# Altium project Task_Tony.PrjPcb (part 3 of 8)

## Sheet Audio_Codec_Sec.SchDoc
size A4; DocumentNumber: 8; SheetNumber: 8; SheetTotal: 28
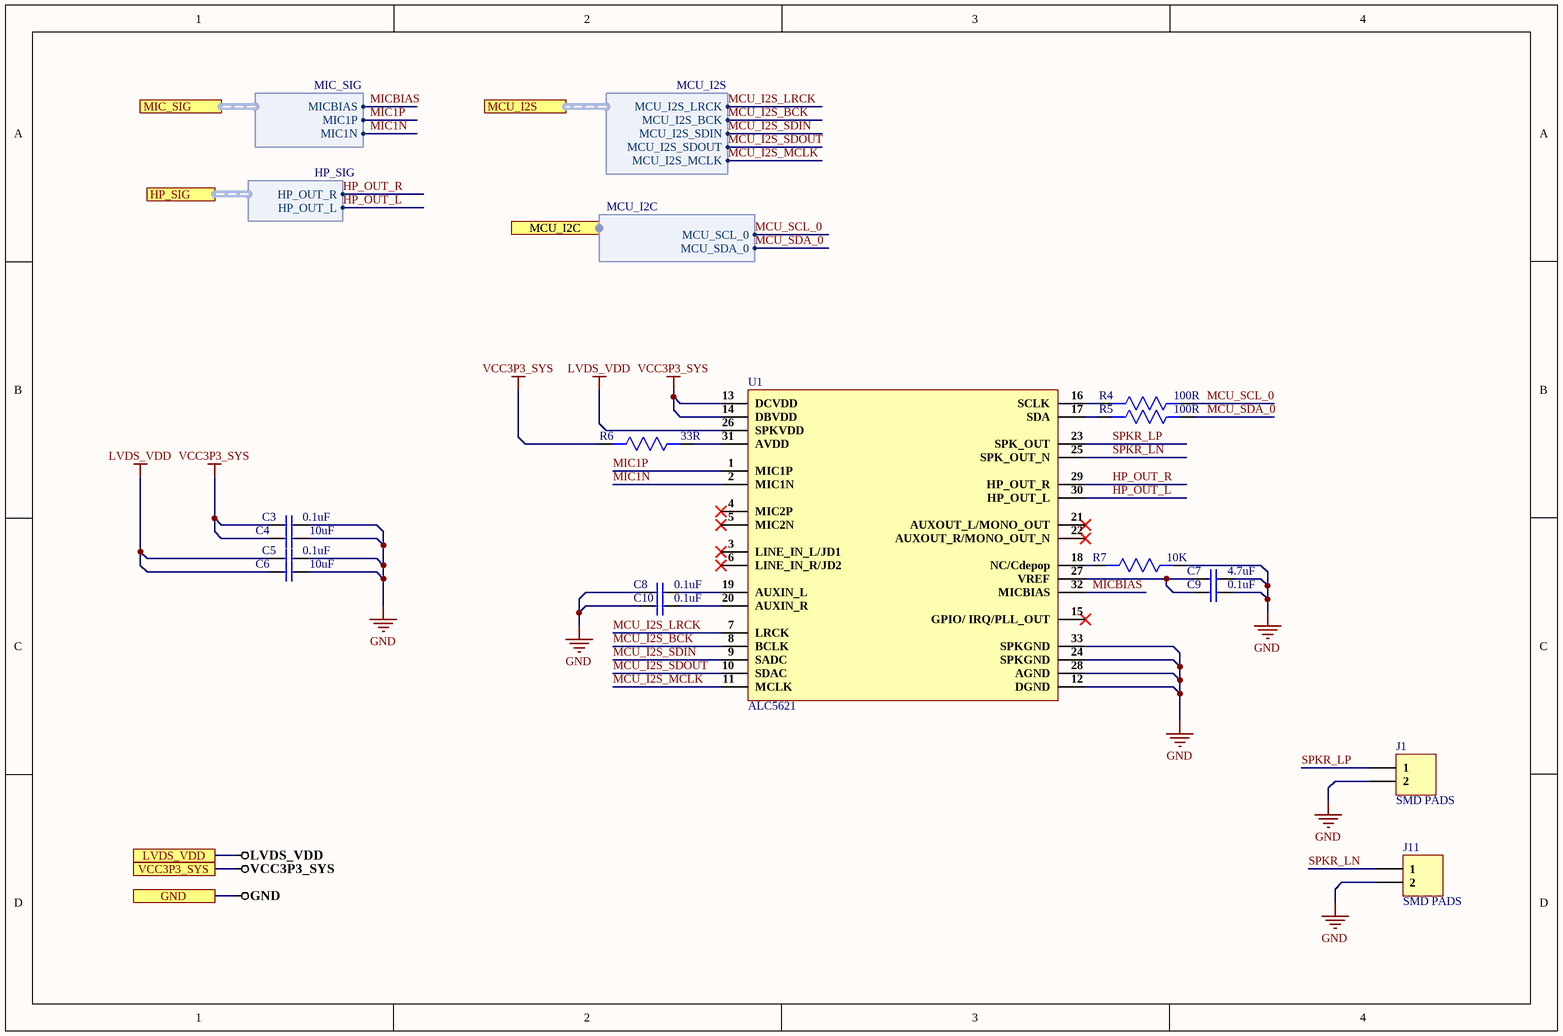
[diagram p11: Audio_Codec_Sec.SchDoc]

### Parts
C3  0.1uF  [Cap0603]
C4  10uF  [Cap0603]
C5  0.1uF  [Cap0603]
C6  10uF  [Cap0603]
C7  4.7uF  [Cap0603]
C8  0.1uF  [Cap0603]
C9  0.1uF  [Cap0603]
C10  0.1uF  [Cap0603]
J1  SMD PADS  [SMD PAD]
J11  SMD PADS  [SMD PAD]
R4  100R  [Res0603]
R5  100R  [Res0603]
R6  33R  [Res0603]
R7  10K  [Res0603]
U1  ALC5621  [32-QFN]

### Ports
GND, HP_SIG (harness HP_SIG), LVDS_VDD, MCU_I2C (harness MCU_I2C), MCU_I2S (harness MCU_I2S), MIC_SIG (harness MIC_SIG), VCC3P3_SYS

### Harnesses
HP_SIG: HP_OUT_R, HP_OUT_L
MCU_I2S: MCU_I2S_LRCK, MCU_I2S_BCK, MCU_I2S_SDIN, MCU_I2S_SDOUT, MCU_I2S_MCLK
MIC_SIG: MICBIAS, MIC1P, MIC1N
MCU_I2C: MCU_SCL_0, MCU_SDA_0

### Nets
GND: C3.2 C4.2 C5.2 C6.2 C7.2 C8.1 C9.2 C10.1 J1.2 J11.2 R7.1 U1.12(DGND) U1.24(SPKGND) U1.28(AGND) U1.33(SPKGND) ; port GND
LVDS_VDD: C5.1 C6.1 U1.26(SPKVDD) ; port LVDS_VDD
VCC3P3_SYS: C3.1 C4.1 R6.2 U1.13(DCVDD) U1.14(DBVDD) ; port VCC3P3_SYS  [project net VCC 3P3_SYS]
HP_OUT_L: U1.30(HP_OUT_L) ; port HP_SIG.HP_OUT_L
HP_OUT_R: U1.29(HP_OUT_R) ; port HP_SIG.HP_OUT_R
MCU_I2S_BCK: U1.8(BCLK) ; port MCU_I2S.MCU_I2S_BCK  [project net MCU_I2S.MCU_I2S_BCK]
MCU_I2S_LRCK: U1.7(LRCK) ; port MCU_I2S.MCU_I2S_LRCK  [project net MCU_I2S.MCU_I2S_LRCK]
MCU_I2S_MCLK: U1.11(MCLK) ; port MCU_I2S.MCU_I2S_MCLK  [project net MCU_I2S.MCU_I2S_MCLK]
MCU_I2S_SDIN: U1.9(SADC) ; port MCU_I2S.MCU_I2S_SDIN  [project net MCU_I2S.MCU_I2S_SDIN]
MCU_I2S_SDOUT: U1.10(SDAC) ; port MCU_I2S.MCU_I2S_SDOUT  [project net MCU_I2S.MCU_I2S_SDOUT]
MCU_SCL_0: R4.1 ; port MCU_I2C.MCU_SCL_0  [project net MCU_I2C.MCU_SCL_0]
MCU_SDA_0: R5.1 ; port MCU_I2C.MCU_SDA_0  [project net MCU_I2C.MCU_SDA_0]
MIC1N: U1.2(MIC1N) ; port MIC_SIG.MIC1N
MIC1P: U1.1(MIC1P) ; port MIC_SIG.MIC1P
MICBIAS: U1.32(MICBIAS) ; port MIC_SIG.MICBIAS
SPKR_LN: J11.1 U1.25(SPK_OUT_N)
SPKR_LP: J1.1 U1.23(SPK_OUT)
NetC7_1: C7.1 C9.1 U1.27(VREF)
NetC8_2: C8.2 U1.19(AUXIN_L)
NetC10_2: C10.2 U1.20(AUXIN_R)
NetR4_2: R4.2 U1.16(SCLK)
NetR5_2: R5.2 U1.17(SDA)
NetR6_1: R6.1 U1.31(AVDD)
NetR7_2: R7.2 U1.18(NC/Cdepop)

Not connected (* = marked no-connect by the designer): U1 3(LINE_IN_L/JD1)* 4(MIC2P)* 5(MIC2N)* 6(LINE_IN_R/JD2)* 15(GPIO/_IRQ/PLL_OUT)* 21(AUXOUT_L/MONO_OUT)* 22(AUXOUT_R/MONO_OUT_N)*

### Library data of the parts
C3 C5 C8-C10 = CC0603ZRY5V9BB104: CAP CER 0.1UF 50V Y5V 0603; Manufacturer: Yageo; Capacitance: 100nF; Tolerance: 80%; Supplier 1: Digi-Key; Manufacturer Part Number: CC0603ZRY5V9BB104; Stock 1: 15000880; Pricing 1: 1=0.1, 10=0.075, 100=0.0334, 500=0.02386, 1000=0.01874 (USD); Mount: Surface Mount; Case/Package: 0603; Number of Pins: 2; Case Code (Metric): 1608; Case Code (Imperial): 0603; Min Operating Temperature: -30°C; Max Operating Temperature: 85°C; Dielectric: Y5V; Voltage Rating: 50V; Package Quantity: 1; Packaging: Tape and Reel; Voltage Rating (DC): 50V; Termination: SMD/SMT; Composition: Ceramic; Voltage: 50V; Length: 1.6mm; Height: 0.8mm; Width: 0.031inch; Thickness: 0.035inch; Depth: 0.8mm; Radiation Hardening: No; REACH SVHC: No SVHC; Lead Free: Lead Free; Halogen Free: Halogen Free; ComponentLink1URL: http://www.yageo.com/documents/recent/UPY-GPHC_Y5V_6.3V-to-50V_8.pdf?src-supplier=Digi-Key; ComponentLink1Description: http://www.yageo.com/documents/recent/UPY-GPHC_Y5V_6.3V-to-50V_8.pdf?src-supplier=Digi-Key; ComponentLink2URL: http://www.yageo.com/documents/recent/UPY-GPHC_Y5V_6.3V-to-50V_5.pdf?src-supplier=Avnet+Europe; ComponentLink2Description: http://www.yageo.com/documents/recent/UPY-GPHC_Y5V_6.3V-to-50V_5.pdf?src-supplier=Avnet+Europe; ComponentLink3URL: https://www.verical.com/server-webapp/html/getDatasheet?partID=403611&src-supplier=Verical; ComponentLink3Description: https://www.verical.com/server-webapp/html/getDatasheet?partID=403611&src-supplier=Verical; ComponentLink4URL: http://www.mouser.com/ds/2/447/Yageo_UPY-GP_NP0_16V-to-50V_9-358835.pdf?src-supplier=Mouser; ComponentLink4Description: http://www.mouser.com/ds/2/447/Yageo_UPY-GP_NP0_16V-to-50V_9-358835.pdf?src-supplier=Mouser; ComponentLink5URL: http://www.farnell.com/datasheets/1132289.pdf?src-supplier=Element14; ComponentLink5Description: http://www.farnell.com/datasheets/1132289.pdf?src-supplier=Element14; Supplier Part Number 1: 311-1343-1-ND
C4 C6 = GRM188R6YA106MA73D: CAP CER 10UF 35V X5R 0603; Manufacturer: Murata; Tolerance: 20%; Supplier 1: Digi-Key; Manufacturer Part Number: GRM188R6YA106MA73D; Stock 1: 11640; Pricing 1: 1=0.5, 10=0.346, 100=0.2076, 500=0.1557, 1000=0.13148 (USD); Mount: Surface Mount; Case/Package: 0603; Case Code (Metric): 1608; Case Code (Imperial): 0603; Min Operating Temperature: -55°C; Max Operating Temperature: 85°C; Packaging: Tape and Reel; Capacitance: 10uF; Voltage Rating: 35V; Voltage Rating (DC): 35V; Dielectric: X5R; Length: 0.063inch; Width: 0.031inch; Thickness: 0.039inch; ComponentLink1URL: http://search.murata.co.jp/Ceramy/image/img/A01X/G101/ENG/GRM188R6YA106MA73-01.pdf?src-supplier=Digi-Key; ComponentLink1Description: http://search.murata.co.jp/Ceramy/image/img/A01X/G101/ENG/GRM188R6YA106MA73-01.pdf?src-supplier=Digi-Key; ComponentLink2URL: http://search.murata.co.jp/Ceramy/image/img/A01X/G101/ENG/GRM188R6YA106MA73-01.pdf?src-supplier=Mouser; ComponentLink2Description: http://search.murata.co.jp/Ceramy/image/img/A01X/G101/ENG/GRM188R6YA106MA73-01.pdf?src-supplier=Mouser; ComponentLink3URL: https://www.murata.com/~/media/webrenewal/support/library/catalog/products/capacitor/mlcc/c02e.ashx?la=en-us&src-supplier=Digi-Key; ComponentLink3Description: https://www.murata.com/~/media/webrenewal/support/library/catalog/products/capacitor/mlcc/c02e.ashx?la=en-us&src-supplier=Digi-Key; ComponentLink4URL: http://search.murata.co.jp/Ceramy/image/img/A01X/G101/ENG/GRM188R6YA106MA73-01.pdf?src-supplier=Future+Electronics; ComponentLink4Description: http://search.murata.co.jp/Ceramy/image/img/A01X/G101/ENG/GRM188R6YA106MA73-01.pdf?src-supplier=Future+Electronics; ComponentLink5URL: http://search.murata.co.jp/Ceramy/image/img/A01X/G101/ENG/GRM188R6YA106MA73-01.pdf?src-supplier=TTI; ComponentLink5Description: http://search.murata.co.jp/Ceramy/image/img/A01X/G101/ENG/GRM188R6YA106MA73-01.pdf?src-supplier=TTI; Supplier Part Number 1: 490-13248-6-ND
C7 = C1608X5R1E475M080AC: CAP CER 4.7UF 25V X5R 0603; Manufacturer: TDK; Dielectric Material: Ceramic; Tolerance: 20%; ComponentLink1URL: http://www.yageo.com/NewPortal/_en/search/productDocs.jsp?YageoPartNumber=AC0603JRNPO0BN470&src-supplier=Digi-Key; ComponentLink1Description: http://www.yageo.com/NewPortal/_en/search/productDocs.jsp?YageoPartNumber=AC0603JRNPO0BN470&src-supplier=Digi-Key; Supplier 1: Mouser; Manufacturer Part Number: C1608X5R1E475M080AC; Stock 1: 40236; Pricing 1: 1=0.29, 10=0.237, 100=0.142, 500=0.106, 1000=0.09, 4000=0.076, 8000=0.072, 24000=0.07, 48000=0.067 (USD); Mount: Surface Mount; Case/Package: 0603; Weight: 7.1E-05oz; Case Code (Metric): 1608; Case Code (Imperial): 0603; Min Operating Temperature: -55°C; Max Operating Temperature: 85°C; Voltage Rating (DC): 25V; Packaging: Tape and Reel; Package Quantity: 1; Capacitance: 4.7uF; Voltage Rating: 25V; Dielectric: X5R; Termination: SMD/SMT; Composition: Ceramic; Length: 1.6mm; Height: 0.8mm; Width: 0.031inch; Thickness: 0.039inch; Depth: 0.8mm; Radiation Hardening: No; REACH SVHC: No SVHC; Lead Free: Lead Free; ComponentLink2URL: https://www.verical.com/server-webapp/html/getDatasheet?partID=726745&src-supplier=Verical; ComponentLink2Description: https://www.verical.com/server-webapp/html/getDatasheet?partID=726745&src-supplier=Verical; Supplier Part Number 1: 810-C1608X5R1E475M
J1 J11 = SMD PAD
R4 R5 = RC0603FR-07100RL: RES SMD 100 OHM 1% 1/10W 0603; Manufacturer: Yageo; Temperature Coefficient: 100ppm/°C; Voltage Rating (DC): 50V; Power Rating: 100mW; Supplier 1: Arrow Electronics; Manufacturer Part Number: RC0603FR-07100RL; RoHS: Yes; Category: Chip SMD Resistors; Stock 1: 3800000; Pricing 1: 5000=0.00300, 5000=0.00200, 5000=0.00450, 50000=0.00410, 500000=0.00230, 2500000=0.00140 (USD); Case/Package: 0603; Number of Pins: 2; Case Code (Imperial): 0603; Case Code (Metric): 1608; Size Code: 0603; Min Operating Temperature: -55°C; Max Operating Temperature: 155°C; Resistance: 100R; Tolerance: 1%; Resistor Type: Thick Film; Packaging: Tape and Reel; Voltage Rating: 50V; Termination: SMD/SMT; Features: Moisture Resistant; Series: RC; Max Power Dissipation: 100mW; Number of Terminations: 2; Construction: Rectangular; Resistance Tolerance: 1%; Technology: THICK FILM; Length: 1.6mm; Width: 0.8mm; Height: 0.45mm; Depth: 0.8mm; REACH SVHC: Unknown; Lead Free: Lead Free; RoHS Compliant: Yes; Military Standard: Not; Supplier Part Number 1: RC0603FR-07100RL
R6 = RC0603FR-0733RL: RES SMD 33 OHM 1% 1/10W 0603; Manufacturer: Yageo; Temperature Coefficient: 100ppm/°C; Voltage Rating (DC): 50V; Power Rating: 100mW; Voltage Rating: 75V; Supplier 1: Digi-Key; Manufacturer Part Number: RC0603FR-0733RL; Stock 1: 5529439; Pricing 1: 1=0.1, 10=0.023, 100=0.0094, 1000=0.00421, 2500=0.00366 (USD); Case/Package: 0603; Number of Pins: 2; Weight: 7.1E-05oz; Case Code (Metric): 1608; Case Code (Imperial): 0603; Min Operating Temperature: -55°C; Max Operating Temperature: 155°C; Resistance: 33R; Tolerance: 1%; Composition: Thick Film; Packaging: Tape and Reel; Package Quantity: 1; Number of Terminations: 2; Termination: SMD/SMT; Military Standard: Not; Max Power Dissipation: 100mW; Features: Moisture Resistant; Length: 1.6mm; Height: 0.45mm; Width: 0.8mm; Depth: 0.8mm; Lead Pitch: 0.3mm; REACH SVHC: No SVHC; Lead Free: Lead Free; ComponentLink1URL: http://www.yageo.com/documents/recent/PYu-RC_Group_51_RoHS_L_10.pdf?src-supplier=Digi-Key; ComponentLink1Description: http://www.yageo.com/documents/recent/PYu-RC_Group_51_RoHS_L_10.pdf?src-supplier=Digi-Key; ComponentLink2URL: http://documents.rs-components.com/techlib://itc_doclist_GB.htm?stockno=5046562&src-supplier=RSComponents; ComponentLink2Description: http://documents.rs-components.com/techlib://itc_doclist_GB.htm?stockno=5046562&src-supplier=RSComponents; ComponentLink3URL: http://www.farnell.com/datasheets/38590.pdf?src-supplier=Element14; ComponentLink3Description: http://www.farnell.com/datasheets/38590.pdf?src-supplier=Element14; ComponentLink4URL: https://www.verical.com/server-webapp/html/getDatasheet?partID=326673&src-supplier=Verical; ComponentLink4Description: https://www.verical.com/server-webapp/html/getDatasheet?partID=326673&src-supplier=Verical; ComponentLink5URL: http://www.farnell.com/datasheets/1868787.pdf?src-supplier=Element14; ComponentLink5Description: http://www.farnell.com/datasheets/1868787.pdf?src-supplier=Element14; ComponentLink6URL: http://www.farnell.com/datasheets/2167052.pdf?src-supplier=Element14; ComponentLink6Description: http://www.farnell.com/datasheets/2167052.pdf?src-supplier=Element14; ComponentLink7URL: http://www.farnell.com/datasheets/443971.pdf?src-supplier=Element14; ComponentLink7Description: http://www.farnell.com/datasheets/443971.pdf?src-supplier=Element14; Supplier Part Number 1: 311-33.0HRCT-ND
R7 = AC0603JR-0710KL: RES SMD 10K OHM 5% 1/10W 0603; Manufacturer: Yageo; Voltage Rating: 50V; Resistance: 10kR; Power Rating: 100mW; Temperature Coefficient: 100ppm/°C; Supplier 1: Future Electronics; Manufacturer Part Number: AC0603JR-0710KL; RoHS: Yes; Category: Chip SMD Resistors; Stock 1: 1533000; Pricing 1: 5000=0.00540 (USD); Case/Package: 0603; Case Code (Imperial): 0603; Case Code (Metric): 1608; Size Code: 0603; Min Operating Temperature: -55°C; Max Operating Temperature: 155°C; Packaging: Tape and Reel; Tolerance: 5%; Package Quantity: 1; Resistor Type: Thick Film; Termination: SMD/SMT; Number of Terminations: 2; Max Power Dissipation: 100mW; Features: Moisture Resistant,Automotive AEC-Q200,Anti-Sulfur; Series: AC; Construction: Rectangular; Length: 0.063inch; Width: 0.031inch; Height: 0.022inch; Depth: 0.8mm; Military Standard: Not; Lead Free: Lead Free; RoHS Compliant: Yes; ComponentLink1URL: https://datasheet.ciiva.com/5562/pyu-ac-51-rohs-l-2-5562553.pdf?src-supplier=Mouser; ComponentLink1Description: https://datasheet.ciiva.com/5562/pyu-ac-51-rohs-l-2-5562553.pdf?src-supplier=Mouser; Supplier Part Number 1: 1029044
U1 = ALC5621: Single I2S/PCM Interface, Stereo, 2.3W Mono Amp, 45mW Headphone Amp; Manufacturer: Realtek; Manufacturer Part No: ALC5621-GR; Value: Custom; Package: QFN-32

## Sheet Headphones_Sec.SchDoc
size A4; DocumentNumber: 9; SheetNumber: 9; SheetTotal: 28
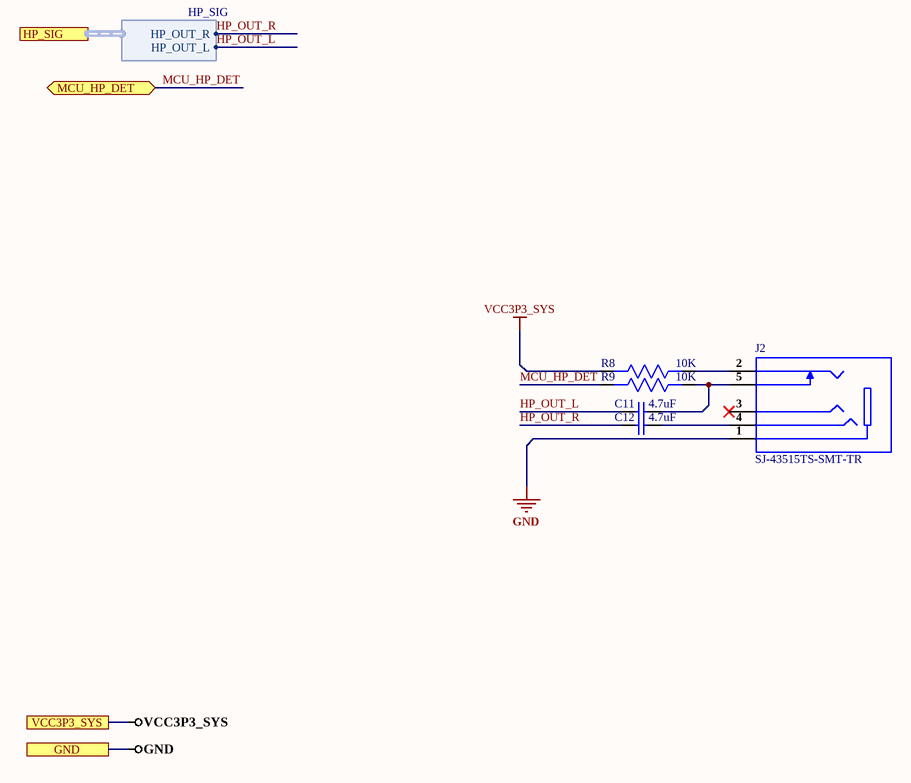
[diagram p12: Headphones_Sec.SchDoc]

### Parts
C11  4.7uF  [Cap0603]
C12  4.7uF  [Cap0603]
J2  SJ-43515TS-SMT-TR  [SJ-43515TS-SMT-TR]
R8  10K  [Res0603]
R9  10K  [Res0603]

### Ports
GND, HP_SIG (harness HP_SIG), MCU_HP_DET (bidir), VCC3P3_SYS

### Harnesses
HP_SIG: HP_OUT_R, HP_OUT_L

### Nets
GND: J2.1 ; port GND
VCC3P3_SYS: R8.2 ; port VCC3P3_SYS  [project net VCC 3P3_SYS]
HP_OUT_L: C11.1 ; port HP_SIG.HP_OUT_L
HP_OUT_R: C12.1 ; port HP_SIG.HP_OUT_R
MCU_HP_DET: R9.2 ; port MCU_HP_DET
NetC11_2: C11.2 J2.5 R9.1
NetC12_2: C12.2 J2.4
NetJ2_2: J2.2 R8.1

Not connected (* = marked no-connect by the designer): J2 3*

### Library data of the parts
C11 C12 = C1608X5R1E475M080AC: as C7 on sheet Audio_Codec_Sec; ComponentLink1URL: http://www.yageo.com/NewPortal/_en/search/productDocs.jsp?YageoPartNumber=AC0603JRNPO0BN470&src-supplier=Digi-Key; ComponentLink1Description: http://www.yageo.com/NewPortal/_en/search/productDocs.jsp?YageoPartNumber=AC0603JRNPO0BN470&src-supplier=Digi-Key; Supplier 1: Mouser; Manufacturer Part Number: C1608X5R1E475M080AC; Stock 1: 40236; Pricing 1: 1=0.29, 10=0.237, 100=0.142, 500=0.106, 1000=0.09, 4000=0.076, 8000=0.072, 24000=0.07, 48000=0.067 (USD); Mount: Surface Mount; Case/Package: 0603; Weight: 7.1E-05oz; Case Code (Metric): 1608; Case Code (Imperial): 0603; Min Operating Temperature: -55°C; Max Operating Temperature: 85°C; Voltage Rating (DC): 25V; Packaging: Tape and Reel; Package Quantity: 1; Capacitance: 4.7uF; Voltage Rating: 25V; Dielectric: X5R; Termination: SMD/SMT; Composition: Ceramic; Length: 1.6mm; Height: 0.8mm; Width: 0.031inch; Thickness: 0.039inch; Depth: 0.8mm; Radiation Hardening: No; REACH SVHC: No SVHC; Lead Free: Lead Free; ComponentLink2URL: https://www.verical.com/server-webapp/html/getDatasheet?partID=726745&src-supplier=Verical; ComponentLink2Description: https://www.verical.com/server-webapp/html/getDatasheet?partID=726745&src-supplier=Verical; Supplier Part Number 1: 810-C1608X5R1E475M
J2 = SJ-43515TS-SMT-TR: CONN JACK 4COND 3.5MM SMD R/A; Manufacturer: CUI; Body Color: Black; Current Rating: 1A; Gender: Female; Shielding: Unshielded; Number of Conductors: 4; Number of Ports: 1; Supplier 1: Digi-Key; Manufacturer Part Number: SJ-43515TS-SMT-TR; RoHS: Yes; Category: Connectors; Stock 1: 51087; Pricing 1: 1=1.07000, 10=0.90600, 25=0.86960, 50=0.85100, 100=0.81400, 250=0.74000, 500=0.66600 (USD); Mount: Surface Mount; Case/Package: SMD/SMT; Contact Plating: Silver; Color: Black; Packaging: Cut Tape; Termination: Solder; Connector Type: Jack; Orientation: Horizontal; Series: SJ; Lead Free: Lead Free; RoHS Compliant: Yes; ComponentLink1URL: https://datasheet.ciiva.com/7368/sj-4351x-smt-series-7368789.pdf?src-supplier=Digi-Key; ComponentLink1Description: https://datasheet.ciiva.com/7368/sj-4351x-smt-series-7368789.pdf?src-supplier=Digi-Key; ComponentLink2URL: https://datasheet.ciiva.com/7368/sj-4351x-smt-series-7368776.pdf?src-supplier=Digi-Key; ComponentLink2Description: https://datasheet.ciiva.com/7368/sj-4351x-smt-series-7368776.pdf?src-supplier=Digi-Key; ComponentLink3URL: https://datasheet.ciiva.com/16215/sj-4351x-smt-series-16215052.pdf?src-supplier=Future+Electronics; ComponentLink3Description: https://datasheet.ciiva.com/16215/sj-4351x-smt-series-16215052.pdf?src-supplier=Future+Electronics; Supplier Part Number 1: CP-43515TSSJCT-ND
R8 R9 = AC0603JR-0710KL: as R7 on sheet Audio_Codec_Sec; Supplier 1: Future Electronics; Manufacturer Part Number: AC0603JR-0710KL; RoHS: Yes; Category: Chip SMD Resistors; Stock 1: 1533000; Pricing 1: 5000=0.00540 (USD); Case/Package: 0603; Case Code (Imperial): 0603; Case Code (Metric): 1608; Size Code: 0603; Min Operating Temperature: -55°C; Max Operating Temperature: 155°C; Packaging: Tape and Reel; Tolerance: 5%; Package Quantity: 1; Resistor Type: Thick Film; Termination: SMD/SMT; Number of Terminations: 2; Max Power Dissipation: 100mW; Features: Moisture Resistant,Automotive AEC-Q200,Anti-Sulfur; Series: AC; Construction: Rectangular; Length: 0.063inch; Width: 0.031inch; Height: 0.022inch; Depth: 0.8mm; Military Standard: Not; Lead Free: Lead Free; RoHS Compliant: Yes; ComponentLink1URL: https://datasheet.ciiva.com/5562/pyu-ac-51-rohs-l-2-5562553.pdf?src-supplier=Mouser; ComponentLink1Description: https://datasheet.ciiva.com/5562/pyu-ac-51-rohs-l-2-5562553.pdf?src-supplier=Mouser; Supplier Part Number 1: 1029044

## Sheet Input_Section.SchDoc
size A4; DocumentNumber: 26; SheetNumber: 26; SheetTotal: 28
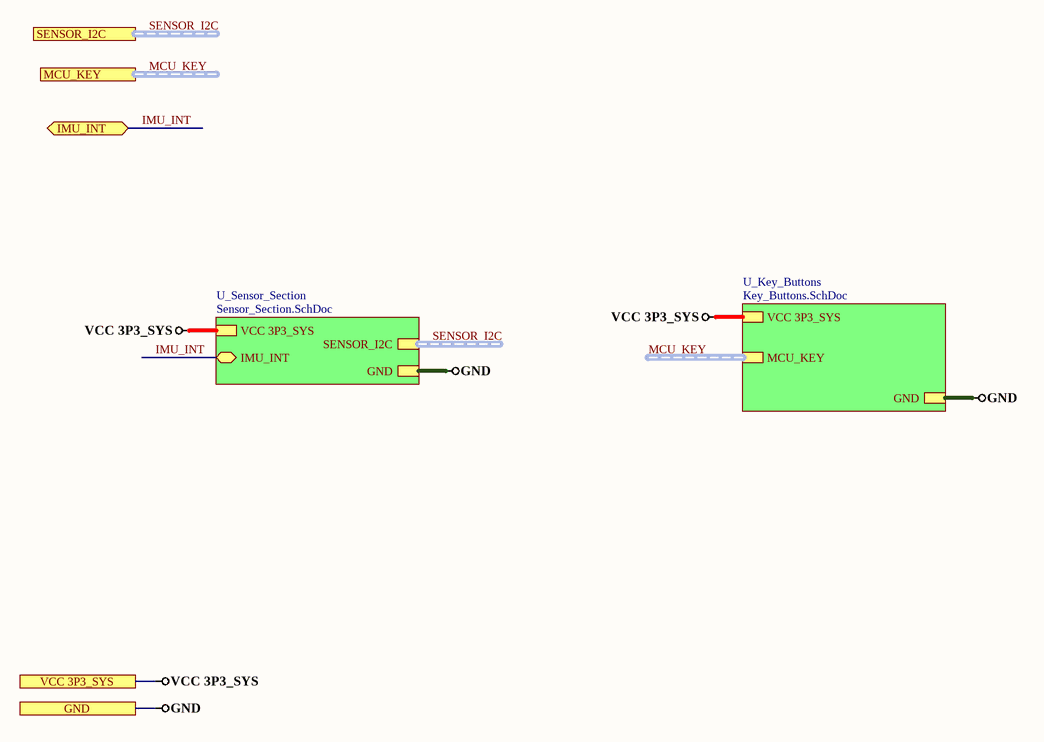
[diagram p13: Input_Section.SchDoc]

### Sub-sheets
U_Key_Buttons = Key_Buttons.SchDoc: MCU_KEY (harness MCU_KEY), VCC 3P3_SYS, GND
U_Sensor_Section = Sensor_Section.SchDoc: VCC 3P3_SYS, GND, SENSOR_I2C (harness SENSOR_I2C), IMU_INT (bidir)

### Ports
GND, IMU_INT (bidir), MCU_KEY (harness MCU_KEY), SENSOR_I2C (harness SENSOR_I2C), VCC 3P3_SYS

### Nets
GND: port GND, sheet U_Sensor_Section/GND, sheet U_Key_Buttons/GND
VCC 3P3_SYS: port VCC 3P3_SYS, sheet U_Sensor_Section/VCC 3P3_SYS, sheet U_Key_Buttons/VCC 3P3_SYS
IMU_INT: port IMU_INT, sheet U_Sensor_Section/IMU_INT

### Buses and harness runs
harness MCU_KEY = port MCU_KEY
harness MCU_KEY = sheet U_Key_Buttons/MCU_KEY
harness SENSOR_I2C = port SENSOR_I2C
harness SENSOR_I2C = sheet U_Sensor_Section/SENSOR_I2C

## Sheet Sensor_Section.SchDoc
size A4; DocumentNumber: 28; SheetNumber: 28; SheetTotal: 28
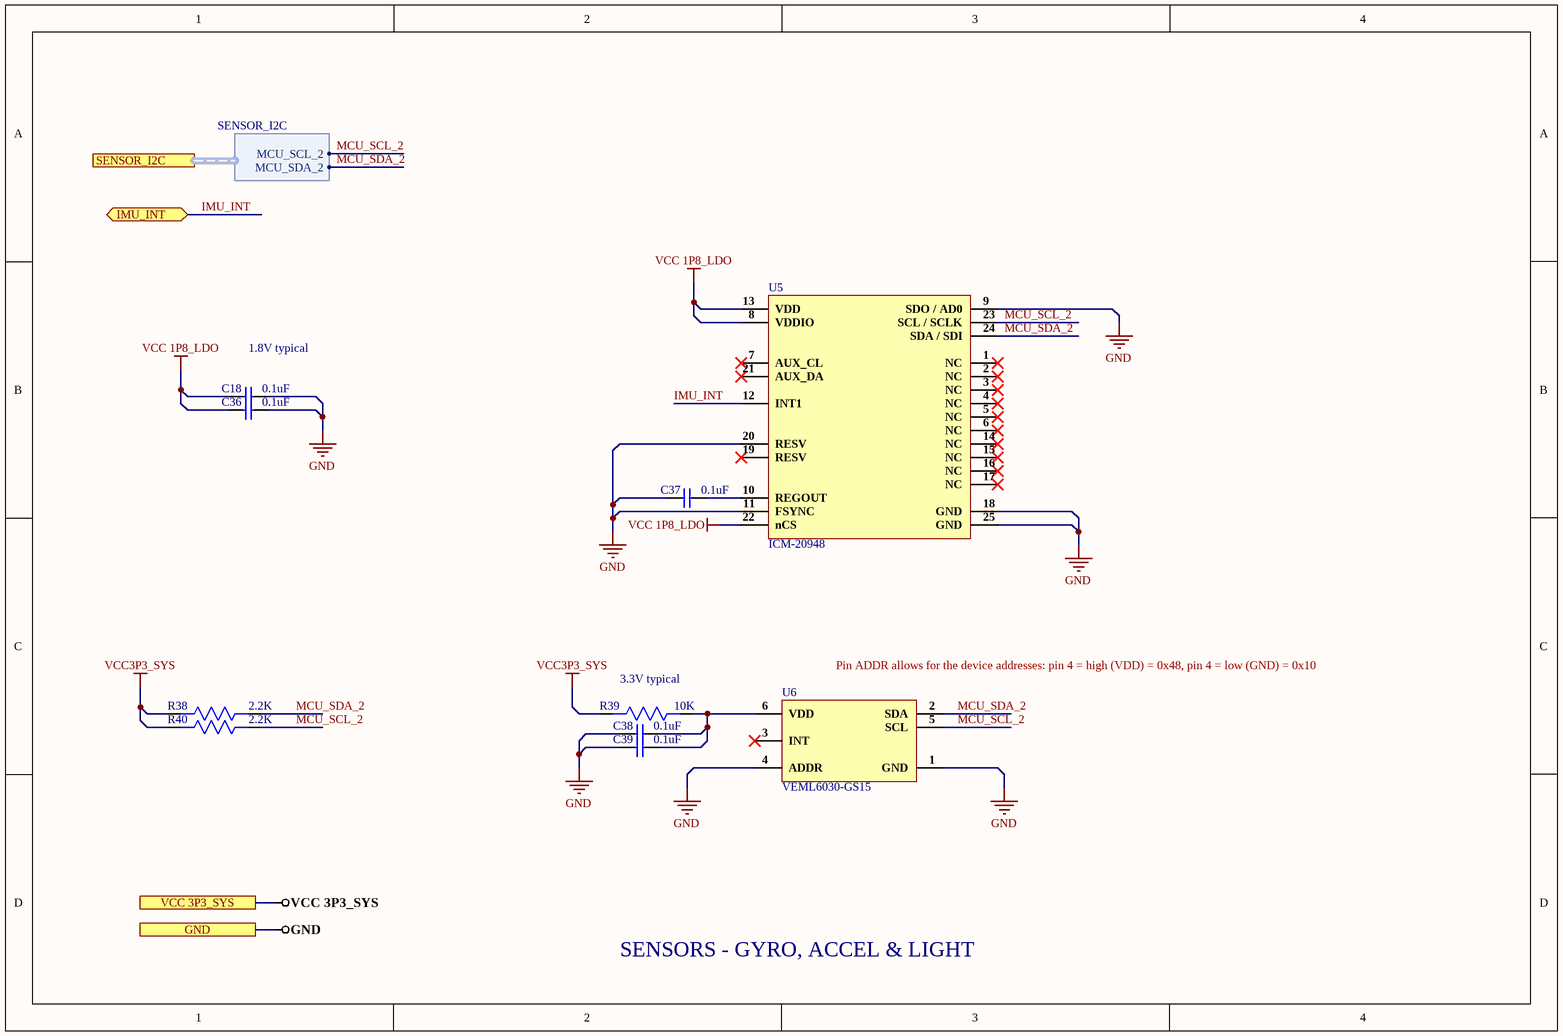
[diagram p14: Sensor_Section.SchDoc]

### Parts
C18  0.1uF  [Cap0603]
C36  0.1uF  [Cap0603]
C37  0.1uF  [Cap0603]
C38  0.1uF  [Cap0603]
C39  0.1uF  [Cap0603]
R38  2.2K  [Res0603]
R39  10K  [Res0603]
R40  2.2K  [Res0603]
U5  ICM-20948  [24-QFN (3x3)]
U6  VEML6030-GS15  [6-SMD]

### Ports
GND, IMU_INT (bidir), SENSOR_I2C (harness SENSOR_I2C), VCC 3P3_SYS

### Harnesses
SENSOR_I2C: MCU_SCL_2, MCU_SDA_2

### Nets
GND: C18.2 C36.2 C37.1 C38.1 C39.1 U5.9(SDO_/_AD0) U5.11(FSYNC) U5.18(GND) U5.20(RESV) U5.25(GND) U6.1(GND) U6.4(ADDR) ; port GND
VCC 1P8_LDO: C18.1 C36.1 U5.8(VDDIO) U5.13(VDD) U5.22(nCS)
VCC 3P3_SYS: R38.2 R39.2 R40.2 ; port VCC 3P3_SYS  [also labelled VCC3P3_SYS]
IMU_INT: U5.12(INT1) ; port IMU_INT
MCU_SCL_2: R40.1 U5.23(SCL_/_SCLK) U6.5(SCL) ; port SENSOR_I2C.MCU_SCL_2
MCU_SDA_2: R38.1 U5.24(SDA_/_SDI) U6.2(SDA) ; port SENSOR_I2C.MCU_SDA_2
NetC37_2: C37.2 U5.10(REGOUT)
NetC38_2: C38.2 C39.2 R39.1 U6.6(VDD)

Not connected (* = marked no-connect by the designer): U5 1(NC)* 2(NC)* 3(NC)* 4(NC)* 5(NC)* 6(NC)* 7(AUX_CL)* 14(NC)* 15(NC)* 16(NC)* 17(NC)* 19(RESV)* 21(AUX_DA)*; U6 3(INT)*

### Notes on the sheet
- 1.8V typical
- (near R39) 3.3V typical
- (near U6) Pin ADDR allows for the device addresses: pin 4 = high (VDD) = 0x48, pin 4 = low (GND) = 0x10
- SENSORS - GYRO, ACCEL & LIGHT

### Library data of the parts
C18 C36-C39 = CC0603ZRY5V9BB104: as C3 on sheet Audio_Codec_Sec; Supplier 1: Digi-Key; Manufacturer Part Number: CC0603ZRY5V9BB104; Stock 1: 15000880; Pricing 1: 1=0.1, 10=0.075, 100=0.0334, 500=0.02386, 1000=0.01874 (USD); Mount: Surface Mount; Case/Package: 0603; Number of Pins: 2; Case Code (Metric): 1608; Case Code (Imperial): 0603; Min Operating Temperature: -30°C; Max Operating Temperature: 85°C; Dielectric: Y5V; Voltage Rating: 50V; Package Quantity: 1; Packaging: Tape and Reel; Voltage Rating (DC): 50V; Termination: SMD/SMT; Composition: Ceramic; Voltage: 50V; Length: 1.6mm; Height: 0.8mm; Width: 0.031inch; Thickness: 0.035inch; Depth: 0.8mm; Radiation Hardening: No; REACH SVHC: No SVHC; Lead Free: Lead Free; Halogen Free: Halogen Free; ComponentLink1URL: http://www.yageo.com/documents/recent/UPY-GPHC_Y5V_6.3V-to-50V_8.pdf?src-supplier=Digi-Key; ComponentLink1Description: http://www.yageo.com/documents/recent/UPY-GPHC_Y5V_6.3V-to-50V_8.pdf?src-supplier=Digi-Key; ComponentLink2URL: http://www.yageo.com/documents/recent/UPY-GPHC_Y5V_6.3V-to-50V_5.pdf?src-supplier=Avnet+Europe; ComponentLink2Description: http://www.yageo.com/documents/recent/UPY-GPHC_Y5V_6.3V-to-50V_5.pdf?src-supplier=Avnet+Europe; ComponentLink3URL: https://www.verical.com/server-webapp/html/getDatasheet?partID=403611&src-supplier=Verical; ComponentLink3Description: https://www.verical.com/server-webapp/html/getDatasheet?partID=403611&src-supplier=Verical; ComponentLink4URL: http://www.mouser.com/ds/2/447/Yageo_UPY-GP_NP0_16V-to-50V_9-358835.pdf?src-supplier=Mouser; ComponentLink4Description: http://www.mouser.com/ds/2/447/Yageo_UPY-GP_NP0_16V-to-50V_9-358835.pdf?src-supplier=Mouser; ComponentLink5URL: http://www.farnell.com/datasheets/1132289.pdf?src-supplier=Element14; ComponentLink5Description: http://www.farnell.com/datasheets/1132289.pdf?src-supplier=Element14; Supplier Part Number 1: 311-1343-1-ND
R38 R40 = RC0603FR-072K2L: RES SMD 2.2K OHM 1% 1/10W 0603; Manufacturer: Yageo Phycomp; Temperature Coefficient: 100ppm/°C; Resistance: 2.2kR; Power Rating: 100mW; Voltage Rating (DC): 50V; Supplier 1: Digi-Key; Manufacturer Part Number: RC0603FR-072K2L; Stock 1: 10587920; Pricing 1: 1=0.1, 10=0.023, 100=0.0094, 1000=0.00421, 2500=0.00366 (USD); Mount: Surface Mount; Case/Package: 0603; Number of Pins: 2; Min Operating Temperature: -55°C; Max Operating Temperature: 155°C; Tolerance: 1%; Packaging: Cut Tape; Length: 1.6mm; Height: 0.45mm; Width: 800um; Depth: 0.8mm; REACH SVHC: No SVHC; Lead Free: Lead Free; Supplier Part Number 1: 311-2.20KHRCT-ND
R39 = AC0603JR-0710KL: as R7 on sheet Audio_Codec_Sec; Supplier 1: Future Electronics; Manufacturer Part Number: AC0603JR-0710KL; RoHS: Yes; Category: Chip SMD Resistors; Stock 1: 1533000; Pricing 1: 5000=0.00540 (USD); Case/Package: 0603; Case Code (Imperial): 0603; Case Code (Metric): 1608; Size Code: 0603; Min Operating Temperature: -55°C; Max Operating Temperature: 155°C; Packaging: Tape and Reel; Tolerance: 5%; Package Quantity: 1; Resistor Type: Thick Film; Termination: SMD/SMT; Number of Terminations: 2; Max Power Dissipation: 100mW; Features: Moisture Resistant,Automotive AEC-Q200,Anti-Sulfur; Series: AC; Construction: Rectangular; Length: 0.063inch; Width: 0.031inch; Height: 0.022inch; Depth: 0.8mm; Military Standard: Not; Lead Free: Lead Free; RoHS Compliant: Yes; ComponentLink1URL: https://datasheet.ciiva.com/5562/pyu-ac-51-rohs-l-2-5562553.pdf?src-supplier=Mouser; ComponentLink1Description: https://datasheet.ciiva.com/5562/pyu-ac-51-rohs-l-2-5562553.pdf?src-supplier=Mouser; Supplier Part Number 1: 1029044
U5 = ICM-20948: IMU ACCEL/GYRO/COMPI2C/SPI 24QFN; Manufacturer: TDK InvenSense; Sensor Type: Accelerometer,Gyroscope,Magnetometer; Output Type: SPI,I2C; Supplier 1: Avnet; Manufacturer Part Number: ICM-20948; RoHS: Yes; Category: Inertial Measurement Units (IMUs); Pricing 1: 5000=3.86240, 10000=3.80800, 20000=3.69920, 30000=3.61760, 40000=3.48160, 50000=3.40000, 500000=3.31840 (USD); Mount: Surface Mount; Case/Package: QFN; Min Operating Temperature: -40°C; Max Operating Temperature: 85°C; Packaging: Tape and Reel; RoHS Compliant: Yes; ComponentLink1URL: http://www.farnell.com/datasheets/2632662.pdf?src-supplier=Farnell; ComponentLink1Description: http://www.farnell.com/datasheets/2632662.pdf?src-supplier=Farnell; ComponentLink2URL: https://www.invensense.com/wp-content/uploads/2016/06/App-Note-eMD-20x48-User-Guide.pdf?src-supplier=Avnet+Europe; ComponentLink2Description: https://www.invensense.com/wp-content/uploads/2016/06/App-Note-eMD-20x48-User-Guide.pdf?src-supplier=Avnet+Europe; ComponentLink3URL: https://www.invensense.com/wp-content/uploads/2016/06/App-Note-eMD-20x48-User-Guide.pdf?src-supplier=Digi-Key; ComponentLink3Description: https://www.invensense.com/wp-content/uploads/2016/06/App-Note-eMD-20x48-User-Guide.pdf?src-supplier=Digi-Key; ComponentLink4URL: http://www.farnell.com/datasheets/2632662.pdf?src-supplier=Element14; ComponentLink4Description: http://www.farnell.com/datasheets/2632662.pdf?src-supplier=Element14; ComponentLink5URL: https://www.invensense.com/wp-content/uploads/2016/06/App-Note-eMD-20x48-User-Guide.pdf?src-supplier=Avnet; ComponentLink5Description: https://www.invensense.com/wp-content/uploads/2016/06/App-Note-eMD-20x48-User-Guide.pdf?src-supplier=Avnet; ComponentLink6URL: https://www.invensense.com/wp-content/uploads/2016/06/App-Note-eMD-20x48-User-Guide.pdf?src-supplier=Component+Distributors+Inc.; ComponentLink6Description: https://www.invensense.com/wp-content/uploads/2016/06/App-Note-eMD-20x48-User-Guide.pdf?src-supplier=Component+Distributors+Inc.; Supplier Part Number 1: ICM-20948
U6 = VEML6030-GS15: SENSOR OPT 550NM AMBIENT 6SMD; Manufacturer: Vishay Semiconductors; Output Type: I2C; Supplier 1: Digi-Key; Manufacturer Part Number: VEML6030-GS15; RoHS: Yes; Category: Sensors; Stock 1: 1250; Pricing 1: 1=2.00000, 5=1.89000, 10=1.62000, 25=1.29600, 50=1.18800, 100=1.08000, 500=0.94500, 1000=0.83700, 5000=0.78300 (USD); Mount: Surface Mount; Case/Package: SMD/SMT; Min Operating Temperature: -25°C; Max Operating Temperature: 85°C; Packaging: Tape and Reel; Wavelength: 550nm; RoHS Compliant: Yes; ComponentLink1URL: http://www.vishay.com/docs/84366/veml6030.pdf?src-supplier=Digi-Key; ComponentLink1Description: http://www.vishay.com/docs/84366/veml6030.pdf?src-supplier=Digi-Key; Supplier Part Number 1: VEML6030-GS15CT-ND

## Sheet Key_Buttons.SchDoc
size A4; DocumentNumber: 27; SheetNumber: 27; SheetTotal: 28
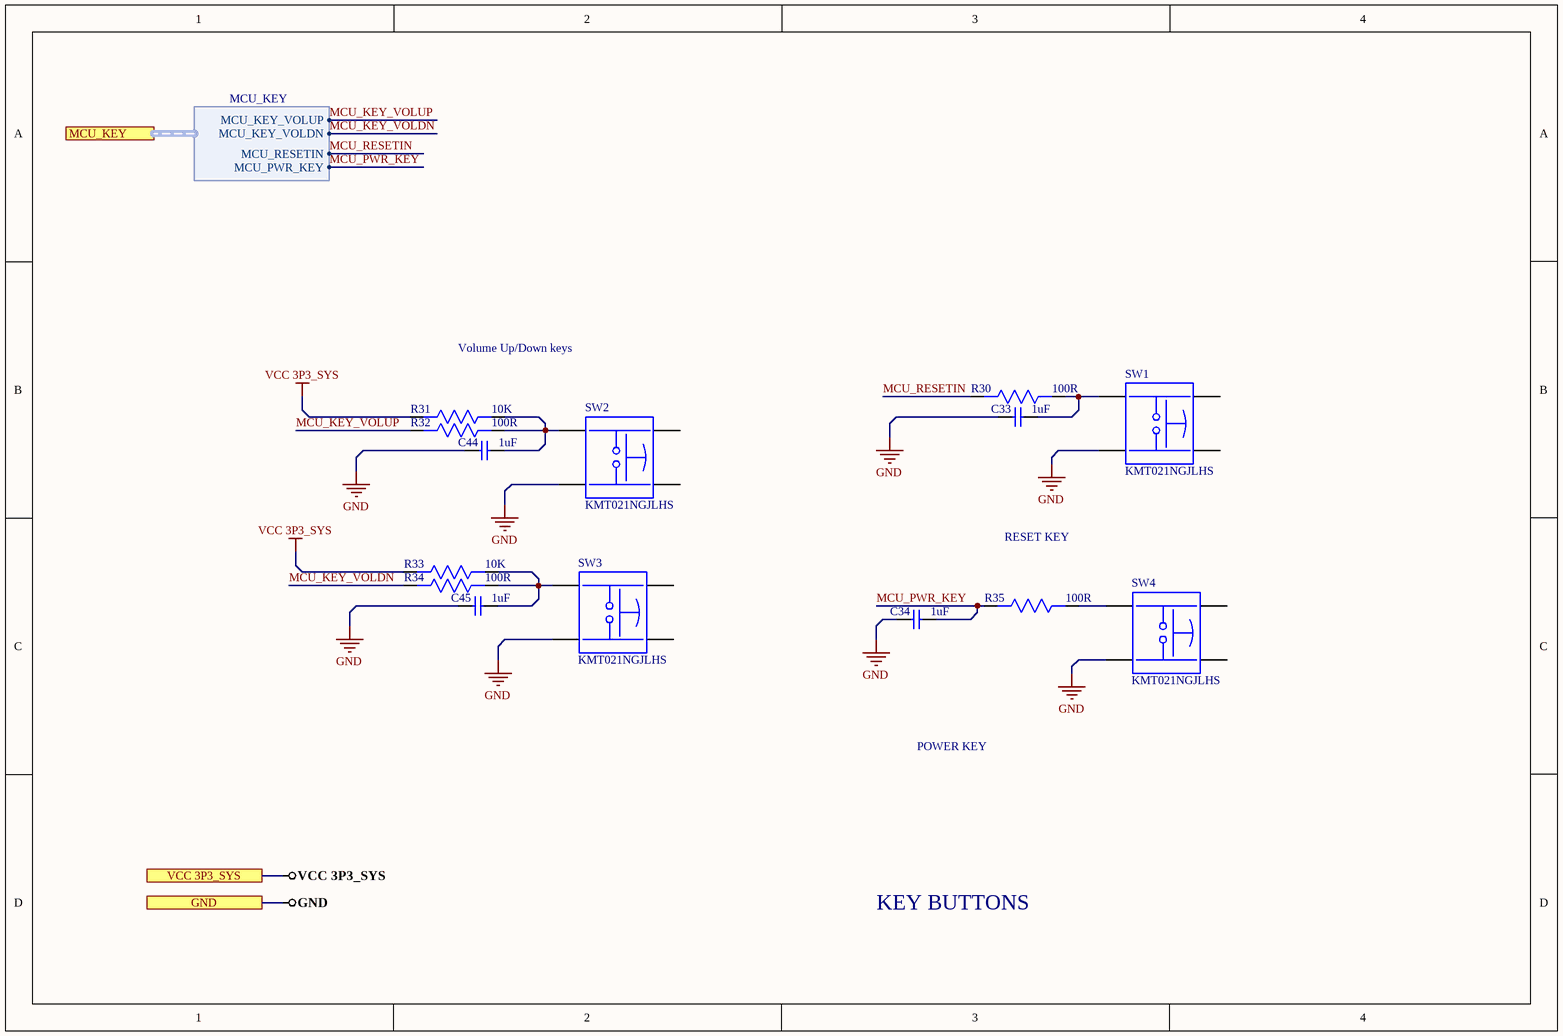
[diagram p15: Key_Buttons.SchDoc]

### Parts
C33  1uF  [Cap0603]
C34  1uF  [Cap0603]
C44  1uF  [Cap0603]
C45  1uF  [Cap0603]
R30  100R  [Res0603]
R31  10K  [Res0603]
R32  100R  [Res0603]
R33  10K  [Res0603]
R34  100R  [Res0603]
R35  100R  [Res0603]
SW1  KMT021NGJLHS  [KMT021NGJLHS]
SW2  KMT021NGJLHS  [KMT021NGJLHS]
SW3  KMT021NGJLHS  [KMT021NGJLHS]
SW4  KMT021NGJLHS  [KMT021NGJLHS]

### Ports
GND, MCU_KEY (harness MCU_KEY), VCC 3P3_SYS

### Harnesses
MCU_KEY: MCU_KEY_VOLUP, MCU_KEY_VOLDN, MCU_RESETIN, MCU_PWR_KEY

### Nets
GND: C33.1 C34.1 C44.1 C45.1 SW1.1 SW2.1 SW3.1 SW4.1 ; port GND
VCC 3P3_SYS: R31.2 R33.2 ; port VCC 3P3_SYS
MCU_KEY_VOLDN: R34.2 ; port MCU_KEY.MCU_KEY_VOLDN  [project net MCU_KEY.MCU_KEY_VOLDN]
MCU_KEY_VOLUP: R32.2 ; port MCU_KEY.MCU_KEY_VOLUP  [project net MCU_KEY.MCU_KEY_VOLUP]
MCU_PWR_KEY: C34.2 R35.2 ; port MCU_KEY.MCU_PWR_KEY  [project net MCU_KEY.MCU_PWR_KEY]
MCU_RESETIN: R30.2 ; port MCU_KEY.MCU_RESETIN  [project net MCU_KEY.MCU_RESETIN]
NetC33_2: C33.2 R30.1 SW1.3
NetC44_2: C44.2 R31.1 R32.1 SW2.3
NetC45_2: C45.2 R33.1 R34.1 SW3.3
NetR35_1: R35.1 SW4.3

Not connected (* = marked no-connect by the designer): SW1 2 4; SW2 2 4; SW3 2 4; SW4 2 4

### Notes on the sheet
- Volume Up/Down keys
- RESET KEY
- POWER KEY
- KEY BUTTONS

### Library data of the parts
C33 C34 C44 C45 = CC0603KRX5R8BB105: CAP CER 1UF 25V X5R 0603; Manufacturer: Yageo; Tolerance: 10%; Supplier 1: Digi-Key; Manufacturer Part Number: CC0603KRX5R8BB105; Stock 1: 459947; Pricing 1: 1=0.1, 10=0.076, 100=0.0337, 500=0.0241, 1000=0.01894 (USD); Mount: Surface Mount; Case/Package: 0603; Number of Pins: 2; Case Code (Metric): 1608; Case Code (Imperial): 0603; Min Operating Temperature: -55°C; Max Operating Temperature: 85°C; Capacitance: 1uF; Dielectric: X5R; Package Quantity: 1; Voltage Rating: 25V; Packaging: Tape and Reel; Termination: SMD/SMT; Voltage Rating (DC): 25V; Length: 1.6mm; Height: 0.8mm; Width: 0.031inch; Thickness: 0.035inch; Depth: 0.8mm; Radiation Hardening: No; REACH SVHC: No SVHC; Lead Free: Lead Free; Halogen Free: Halogen Free; ComponentLink1URL: http://www.yageo.com/documents/recent/UPY-GPHC_X5R_4V-to-50V_25.pdf?src-supplier=Digi-Key; ComponentLink1Description: http://www.yageo.com/documents/recent/UPY-GPHC_X5R_4V-to-50V_25.pdf?src-supplier=Digi-Key; ComponentLink2URL: http://www.yageo.com/documents/recent/UPY-GPHC_X5R_4V-to-50V_12.pdf?src-supplier=Avnet+Europe; ComponentLink2Description: http://www.yageo.com/documents/recent/UPY-GPHC_X5R_4V-to-50V_12.pdf?src-supplier=Avnet+Europe; ComponentLink3URL: http://www.farnell.com/datasheets/1525783.pdf?src-supplier=Element14; ComponentLink3Description: http://www.farnell.com/datasheets/1525783.pdf?src-supplier=Element14; ComponentLink4URL: http://www.yageo.com/documents/recent/UPY-GPHC_X5R_4V-to-50V_12.pdf?src-supplier=Avnet; ComponentLink4Description: http://www.yageo.com/documents/recent/UPY-GPHC_X5R_4V-to-50V_12.pdf?src-supplier=Avnet; Supplier Part Number 1: 311-1445-1-ND
R30 R32 R34 R35 = RC0603FR-07100RL: as R4 on sheet Audio_Codec_Sec; Supplier 1: Arrow Electronics; Manufacturer Part Number: RC0603FR-07100RL; RoHS: Yes; Category: Chip SMD Resistors; Stock 1: 3800000; Pricing 1: 5000=0.00300, 5000=0.00200, 5000=0.00450, 50000=0.00410, 500000=0.00230, 2500000=0.00140 (USD); Case/Package: 0603; Number of Pins: 2; Case Code (Imperial): 0603; Case Code (Metric): 1608; Size Code: 0603; Min Operating Temperature: -55°C; Max Operating Temperature: 155°C; Resistance: 100R; Tolerance: 1%; Resistor Type: Thick Film; Packaging: Tape and Reel; Voltage Rating: 50V; Termination: SMD/SMT; Features: Moisture Resistant; Series: RC; Max Power Dissipation: 100mW; Number of Terminations: 2; Construction: Rectangular; Resistance Tolerance: 1%; Technology: THICK FILM; Length: 1.6mm; Width: 0.8mm; Height: 0.45mm; Depth: 0.8mm; REACH SVHC: Unknown; Lead Free: Lead Free; RoHS Compliant: Yes; Military Standard: Not; Supplier Part Number 1: RC0603FR-07100RL
R31 R33 = AC0603JR-0710KL: as R7 on sheet Audio_Codec_Sec; Supplier 1: Future Electronics; Manufacturer Part Number: AC0603JR-0710KL; RoHS: Yes; Category: Chip SMD Resistors; Stock 1: 1533000; Pricing 1: 5000=0.00540 (USD); Case/Package: 0603; Case Code (Imperial): 0603; Case Code (Metric): 1608; Size Code: 0603; Min Operating Temperature: -55°C; Max Operating Temperature: 155°C; Packaging: Tape and Reel; Tolerance: 5%; Package Quantity: 1; Resistor Type: Thick Film; Termination: SMD/SMT; Number of Terminations: 2; Max Power Dissipation: 100mW; Features: Moisture Resistant,Automotive AEC-Q200,Anti-Sulfur; Series: AC; Construction: Rectangular; Length: 0.063inch; Width: 0.031inch; Height: 0.022inch; Depth: 0.8mm; Military Standard: Not; Lead Free: Lead Free; RoHS Compliant: Yes; ComponentLink1URL: https://datasheet.ciiva.com/5562/pyu-ac-51-rohs-l-2-5562553.pdf?src-supplier=Mouser; ComponentLink1Description: https://datasheet.ciiva.com/5562/pyu-ac-51-rohs-l-2-5562553.pdf?src-supplier=Mouser; Supplier Part Number 1: 1029044
SW1-SW4 = KMT021NGJLHS: SWITCH TACTILE SPST-NO 0.05A 32V; Manufacturer: ITT C&K; Mechanical Life: 300000Cycles; Operating Force: 1.6N; Throw Configuration: SPST; Max Current Rating: 50mA; Power Rating: 500mW; Illumination Type: Non-Illuminated,Illuminated; Switch Travel: 0.15mm; Switch Function: Off-Mom; Actuator Type: Standard; Ratings: IP68,Waterproof,Dust Tight; Supplier 1: Digi-Key; Manufacturer Part Number: KMT021NGJLHS; RoHS: Yes; Category: Tactile Switches; Stock 1: 5223; Pricing 1: 1=0.30000, 10=0.29500, 25=0.27960, 100=0.25310, 250=0.23076, 500=0.21448, 1000=0.18297, 2500=0.17789 (USD); Mount: Surface Mount; Case/Package: SMD/SMT; Contact Material: Silver; Contact Plating: Silver; Min Operating Temperature: -40°C; Max Operating Temperature: 85°C; Max Voltage Rating (DC): 32V; Termination: J-Lead; Packaging: Tape and Reel; Package Quantity: 5000; Voltage Rating (DC): 32V; Current Rating: 50mA; Orientation: Straight; Series: KMT0; Length: 2.6mm; Depth: 3.4mm; Radiation Hardening: No; REACH SVHC: No SVHC; Lead Free: Lead Free; RoHS Compliant: Yes; ComponentLink1URL: https://datasheet.ciiva.com/5684/1443640-5684448.pdf?src-supplier=Farnell; ComponentLink1Description: https://datasheet.ciiva.com/5684/1443640-5684448.pdf?src-supplier=Farnell; ComponentLink2URL: https://datasheet.ciiva.com/2900/kmt-0xx-ngj-lhs-drawing-2900147.pdf?src-supplier=Digi-Key; ComponentLink2Description: https://datasheet.ciiva.com/2900/kmt-0xx-ngj-lhs-drawing-2900147.pdf?src-supplier=Digi-Key; ComponentLink3URL: https://datasheet.ciiva.com/2900/kmt-0xx-ngj-lhs-drawing-2900148.pdf?src-supplier=Digi-Key; ComponentLink3Description: https://datasheet.ciiva.com/2900/kmt-0xx-ngj-lhs-drawing-2900148.pdf?src-supplier=Digi-Key; ComponentLink4URL: https://datasheet.ciiva.com/2900/kmt-0xx-ngj-lhs-drawing-2900149.pdf?src-supplier=Digi-Key; ComponentLink4Description: https://datasheet.ciiva.com/2900/kmt-0xx-ngj-lhs-drawing-2900149.pdf?src-supplier=Digi-Key; ComponentLink5URL: https://datasheet.ciiva.com/22712/1443640-22712102.pdf?src-supplier=Element14; ComponentLink5Description: https://datasheet.ciiva.com/22712/1443640-22712102.pdf?src-supplier=Element14; ComponentLink6URL: https://datasheet.ciiva.com/7986/1443640-7986975.pdf?src-supplier=Element14; ComponentLink6Description: https://datasheet.ciiva.com/7986/1443640-7986975.pdf?src-supplier=Element14; Supplier Part Number 1: CKN10289CT-ND

## Sheet USB_Sec.SchDoc
size A4; DocumentNumber: 23; SheetNumber: 23; SheetTotal: 28
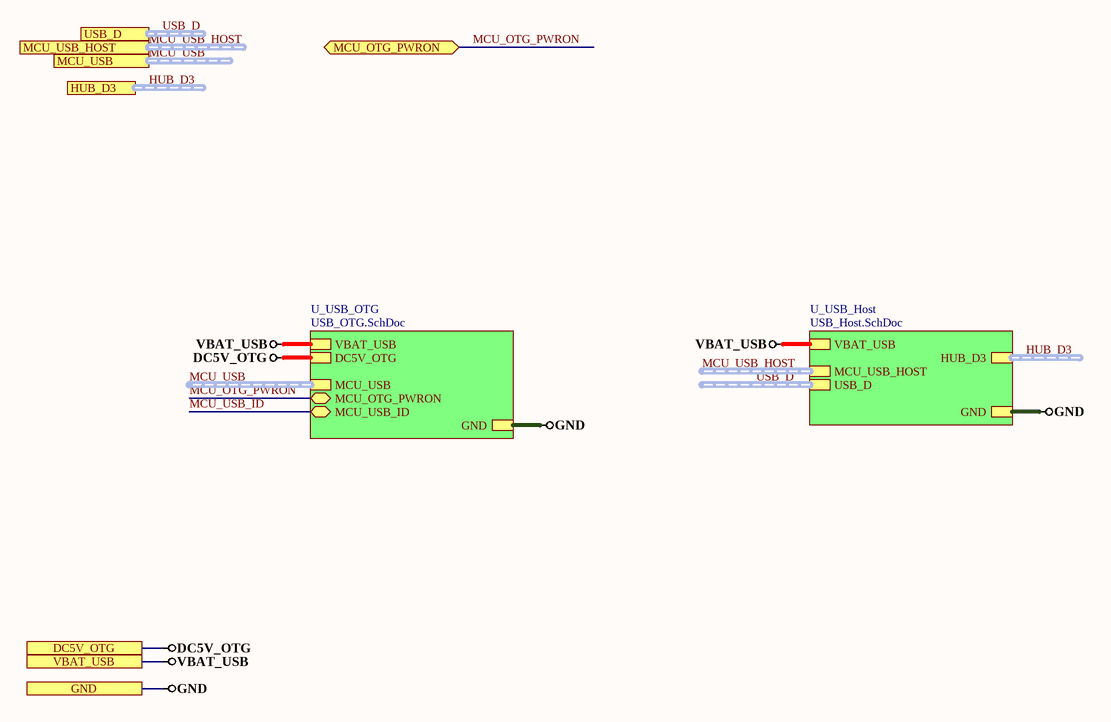
[diagram p16: USB_Sec.SchDoc]

### Sub-sheets
U_USB_Host = USB_Host.SchDoc: MCU_USB_HOST (harness MCU_USB_HOST), USB_D (harness USB_D), VBAT_USB, GND, HUB_D3 (harness HUB_D3)
U_USB_OTG = USB_OTG.SchDoc: MCU_USB (harness MCU_USB), MCU_OTG_PWRON (bidir), VBAT_USB, GND, MCU_USB_ID (bidir), DC5V_OTG

### Ports
DC5V_OTG, GND, HUB_D3 (harness HUB_D3), MCU_OTG_PWRON (bidir), MCU_USB (harness MCU_USB), MCU_USB_HOST (harness MCU_USB_HOST), USB_D (harness USB_D), VBAT_USB

### Nets
DC5V_OTG: port DC5V_OTG, sheet U_USB_OTG/DC5V_OTG
GND: port GND, sheet U_USB_OTG/GND, sheet U_USB_Host/GND
VBAT_USB: port VBAT_USB, sheet U_USB_OTG/VBAT_USB, sheet U_USB_Host/VBAT_USB
MCU_OTG_PWRON: port MCU_OTG_PWRON, sheet U_USB_OTG/MCU_OTG_PWRON

### Buses and harness runs
harness HUB_D3 = port HUB_D3
harness HUB_D3 = sheet U_USB_Host/HUB_D3
harness MCU_USB = port MCU_USB
harness MCU_USB = sheet U_USB_OTG/MCU_USB
harness MCU_USB_HOST = port MCU_USB_HOST
harness MCU_USB_HOST = sheet U_USB_Host/MCU_USB_HOST
harness USB_D = port USB_D
harness USB_D = sheet U_USB_Host/USB_D

## Sheet USB_OTG.SchDoc
size A4; DocumentNumber: 24; SheetNumber: 24; SheetTotal: 28
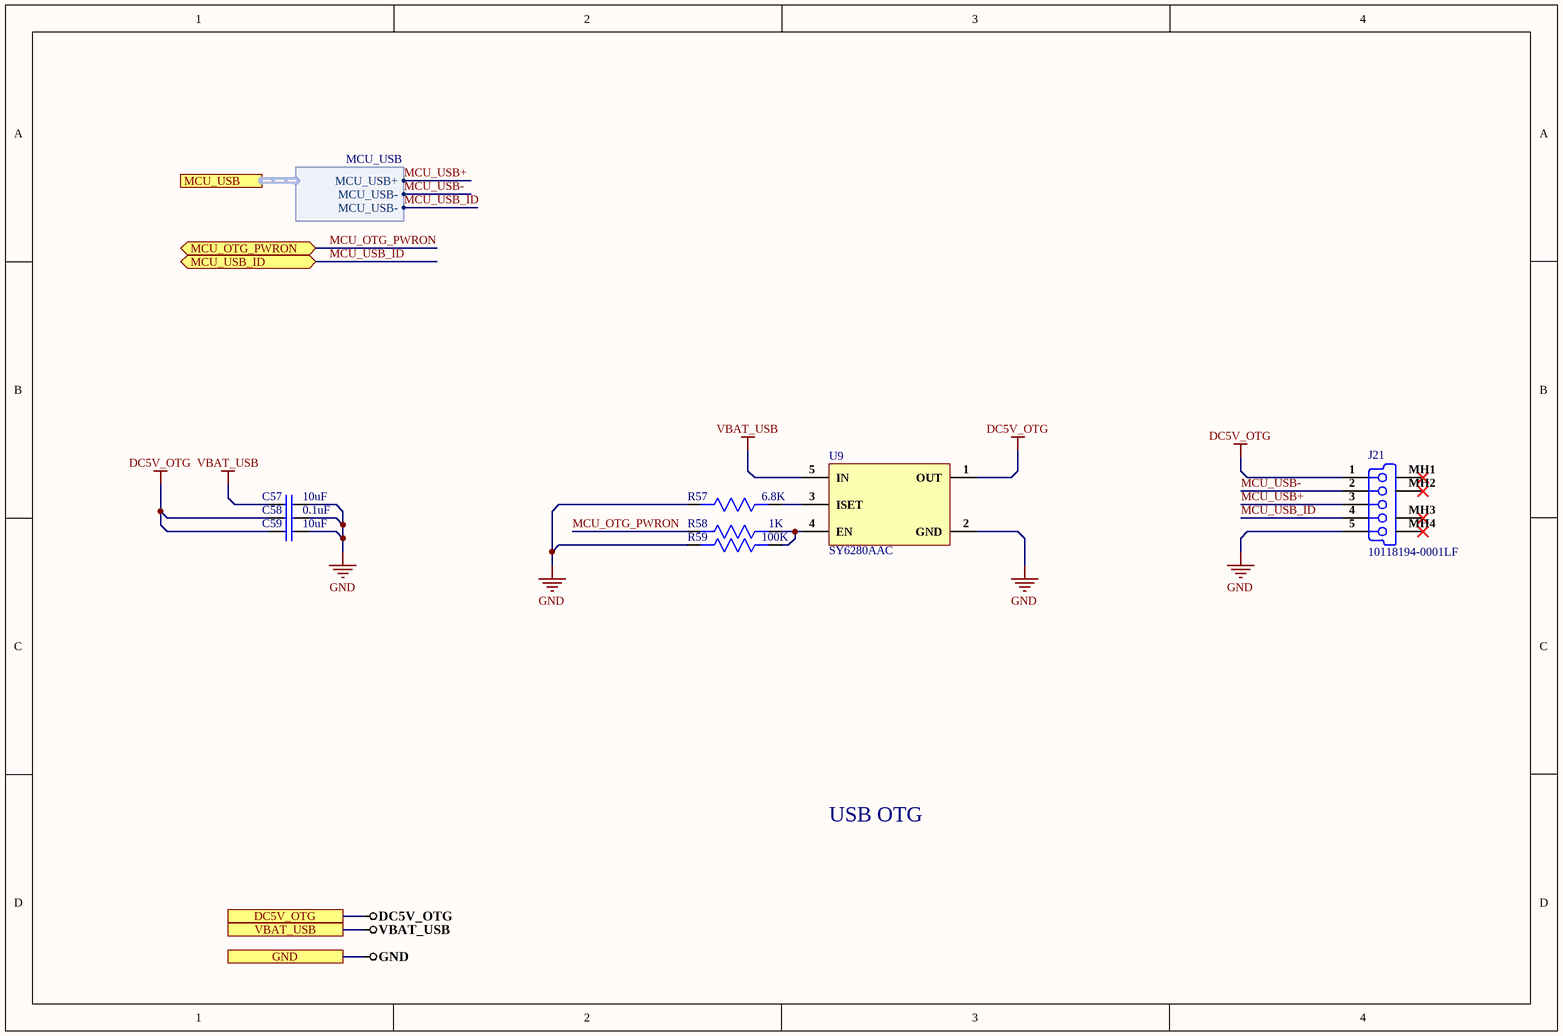
[diagram p17: USB_OTG.SchDoc]

### Parts
C57  10uF  [Cap0603]
C58  0.1uF  [Cap0603]
C59  10uF  [Cap0603]
J21  10118194-0001LF  [10118194-0001LF]
R57  6.8K  [Res0603]
R58  1K  [Res0603]
R59  100K  [Res0603]
U9  SY6280AAC  [SOT23-5]

### Ports
DC5V_OTG, GND, MCU_OTG_PWRON (bidir), MCU_USB (harness MCU_USB), MCU_USB_ID (bidir), VBAT_USB

### Harnesses
MCU_USB: MCU_USB+, MCU_USB-, MCU_USB-

### Nets
DC5V_OTG: C58.1 C59.1 J21.1(V_BUS_(5V)) U9.1(OUT) ; port DC5V_OTG
GND: C57.2 C58.2 C59.2 J21.5(GND) R57.2 R59.2 U9.2(GND) ; port GND
VBAT_USB: C57.1 U9.5(IN) ; port VBAT_USB
MCU_OTG_PWRON: R58.2 ; port MCU_OTG_PWRON
MCU_USB+: J21.3(D+) ; port MCU_USB.MCU_USB+
MCU_USB-: J21.2(D-) J21.4(NC) ; port MCU_USB_ID, port MCU_USB.MCU_USB-  [also labelled MCU_USB_ID]
NetR57_1: R57.1 U9.3(ISET)
NetR58_1: R58.1 R59.1 U9.4(EN)

Not connected (* = marked no-connect by the designer): J21 MH1(Tab)* MH2(Tab)* MH3(Tab)* MH4(Tab)*

### Notes on the sheet
- USB OTG

### Library data of the parts
C57 C59 = GRM188R6YA106MA73D: as C4 on sheet Audio_Codec_Sec; Supplier 1: Digi-Key; Manufacturer Part Number: GRM188R6YA106MA73D; Stock 1: 11640; Pricing 1: 1=0.5, 10=0.346, 100=0.2076, 500=0.1557, 1000=0.13148 (USD); Mount: Surface Mount; Case/Package: 0603; Case Code (Metric): 1608; Case Code (Imperial): 0603; Min Operating Temperature: -55°C; Max Operating Temperature: 85°C; Packaging: Tape and Reel; Capacitance: 10uF; Voltage Rating: 35V; Voltage Rating (DC): 35V; Dielectric: X5R; Length: 0.063inch; Width: 0.031inch; Thickness: 0.039inch; ComponentLink1URL: http://search.murata.co.jp/Ceramy/image/img/A01X/G101/ENG/GRM188R6YA106MA73-01.pdf?src-supplier=Digi-Key; ComponentLink1Description: http://search.murata.co.jp/Ceramy/image/img/A01X/G101/ENG/GRM188R6YA106MA73-01.pdf?src-supplier=Digi-Key; ComponentLink2URL: http://search.murata.co.jp/Ceramy/image/img/A01X/G101/ENG/GRM188R6YA106MA73-01.pdf?src-supplier=Mouser; ComponentLink2Description: http://search.murata.co.jp/Ceramy/image/img/A01X/G101/ENG/GRM188R6YA106MA73-01.pdf?src-supplier=Mouser; ComponentLink3URL: https://www.murata.com/~/media/webrenewal/support/library/catalog/products/capacitor/mlcc/c02e.ashx?la=en-us&src-supplier=Digi-Key; ComponentLink3Description: https://www.murata.com/~/media/webrenewal/support/library/catalog/products/capacitor/mlcc/c02e.ashx?la=en-us&src-supplier=Digi-Key; ComponentLink4URL: http://search.murata.co.jp/Ceramy/image/img/A01X/G101/ENG/GRM188R6YA106MA73-01.pdf?src-supplier=Future+Electronics; ComponentLink4Description: http://search.murata.co.jp/Ceramy/image/img/A01X/G101/ENG/GRM188R6YA106MA73-01.pdf?src-supplier=Future+Electronics; ComponentLink5URL: http://search.murata.co.jp/Ceramy/image/img/A01X/G101/ENG/GRM188R6YA106MA73-01.pdf?src-supplier=TTI; ComponentLink5Description: http://search.murata.co.jp/Ceramy/image/img/A01X/G101/ENG/GRM188R6YA106MA73-01.pdf?src-supplier=TTI; Supplier Part Number 1: 490-13248-6-ND
C58 = CC0603ZRY5V9BB104: as C3 on sheet Audio_Codec_Sec; Supplier 1: Digi-Key; Manufacturer Part Number: CC0603ZRY5V9BB104; Stock 1: 15000880; Pricing 1: 1=0.1, 10=0.075, 100=0.0334, 500=0.02386, 1000=0.01874 (USD); Mount: Surface Mount; Case/Package: 0603; Number of Pins: 2; Case Code (Metric): 1608; Case Code (Imperial): 0603; Min Operating Temperature: -30°C; Max Operating Temperature: 85°C; Dielectric: Y5V; Voltage Rating: 50V; Package Quantity: 1; Packaging: Tape and Reel; Voltage Rating (DC): 50V; Termination: SMD/SMT; Composition: Ceramic; Voltage: 50V; Length: 1.6mm; Height: 0.8mm; Width: 0.031inch; Thickness: 0.035inch; Depth: 0.8mm; Radiation Hardening: No; REACH SVHC: No SVHC; Lead Free: Lead Free; Halogen Free: Halogen Free; ComponentLink1URL: http://www.yageo.com/documents/recent/UPY-GPHC_Y5V_6.3V-to-50V_8.pdf?src-supplier=Digi-Key; ComponentLink1Description: http://www.yageo.com/documents/recent/UPY-GPHC_Y5V_6.3V-to-50V_8.pdf?src-supplier=Digi-Key; ComponentLink2URL: http://www.yageo.com/documents/recent/UPY-GPHC_Y5V_6.3V-to-50V_5.pdf?src-supplier=Avnet+Europe; ComponentLink2Description: http://www.yageo.com/documents/recent/UPY-GPHC_Y5V_6.3V-to-50V_5.pdf?src-supplier=Avnet+Europe; ComponentLink3URL: https://www.verical.com/server-webapp/html/getDatasheet?partID=403611&src-supplier=Verical; ComponentLink3Description: https://www.verical.com/server-webapp/html/getDatasheet?partID=403611&src-supplier=Verical; ComponentLink4URL: http://www.mouser.com/ds/2/447/Yageo_UPY-GP_NP0_16V-to-50V_9-358835.pdf?src-supplier=Mouser; ComponentLink4Description: http://www.mouser.com/ds/2/447/Yageo_UPY-GP_NP0_16V-to-50V_9-358835.pdf?src-supplier=Mouser; ComponentLink5URL: http://www.farnell.com/datasheets/1132289.pdf?src-supplier=Element14; ComponentLink5Description: http://www.farnell.com/datasheets/1132289.pdf?src-supplier=Element14; Supplier Part Number 1: 311-1343-1-ND
J21 = 10118194-0001LF: USB - Micro B Female USB 2 5 SMD USB Connectors RoHS; Manufacturer: Amphenol FCI; Gender: Receptacle; Current Rating: 1.8A; Connector Type: USB,Receptacle; Number of Contacts: 5; Insulation Resistance: 1GR; Number of Ports: 1; Max Voltage Rating (AC): 100V; Pitch: 0.65mm; Supplier 1: Digi-Key; Manufacturer Part Number: 10118194-0001LF; Stock 1: 35943; Pricing 1: 1=0.43, 10=0.405, 25=0.3648, 50=0.3242, 100=0.3107, 250=0.28368, 500=0.27016 (USD); Mount: Surface Mount,Horizontal; Color: Black; Contact Material: Copper Alloy; Contact Plating: Gold; Number of Terminals: 5; Housing Material: Polymer; Min Operating Temperature: -55°C; Max Operating Temperature: 85°C; Package Quantity: 9600; Packaging: Tape and Reel; Termination: Solder; Orientation: Right Angle; Features: Shielded; Length: 8.05mm; Depth: 5mm; Radiation Hardening: No; Lead Free: Lead Free; Flammability Rating: UL94 V-0; ComponentLink1URL: http://www.amphenol-icc.com/media/wysiwyg/files/drawing/10118194.pdf?src-supplier=Digi-Key; ComponentLink1Description: http://www.amphenol-icc.com/media/wysiwyg/files/drawing/10118194.pdf?src-supplier=Digi-Key; ComponentLink2URL: https://cdn.amphenol-icc.com/media/wysiwyg/files/drawing/10118194.pdf?src-supplier=Mouser; ComponentLink2Description: https://cdn.amphenol-icc.com/media/wysiwyg/files/drawing/10118194.pdf?src-supplier=Mouser; ComponentLink3URL: https://cdn.amphenol-icc.com/media/wysiwyg/files/drawing/10118194.pdf?src-supplier=Verical; ComponentLink3Description: https://cdn.amphenol-icc.com/media/wysiwyg/files/drawing/10118194.pdf?src-supplier=Verical; Supplier Part Number 1: 609-4618-1-ND
R57 = ESR03EZPJ682: RES SMD 6.8K OHM 5% 1/4W 0603; Manufacturer: Rohm; Resistance: 6.8kR; Max Power Dissipation: 250mW; Temperature Coefficient: 200ppm/°C; Supplier 1: Digi-Key; Manufacturer Part Number: ESR03EZPJ682; RoHS: Yes; Category: Chip SMD Resistors; Stock 1: 4769; Pricing 1: 1=0.10000, 10=0.08200, 100=0.03160, 1000=0.01392, 2500=0.01202 (USD); Case/Package: 0603; Case Code (Metric): 1608; Case Code (Imperial): 0603; Min Operating Temperature: -55°C; Max Operating Temperature: 155°C; Package Quantity: 5000; Packaging: Cut Tape; Tolerance: 5%; Resistor Type: Thick Film; Number of Terminations: 2; Features: Automotive AEC-Q200; Series: ESR; Length: 0.063inch; Width: 0.031inch; Height: 0.022inch; Lead Free: Lead Free; RoHS Compliant: Yes; ComponentLink1URL: https://datasheet.ciiva.com/14928/esr-14928716.pdf?src-supplier=Digi-Key; ComponentLink1Description: https://datasheet.ciiva.com/14928/esr-14928716.pdf?src-supplier=Digi-Key; ComponentLink2URL: https://datasheet.ciiva.com/14930/esr-14930536.pdf?src-supplier=Digi-Key; ComponentLink2Description: https://datasheet.ciiva.com/14930/esr-14930536.pdf?src-supplier=Digi-Key; ComponentLink3URL: https://datasheet.ciiva.com/14932/esr-14932333.pdf?src-supplier=Digi-Key; ComponentLink3Description: https://datasheet.ciiva.com/14932/esr-14932333.pdf?src-supplier=Digi-Key; Supplier Part Number 1: RHM6.8KDCT-ND
R58 = RC0603FR-071KL: RES SMD 1K OHM 1% 1/10W 0603; Manufacturer: Yageo; Resistance: 1kR; Temperature Coefficient: 100ppm/°C; Power Rating: 100mW; Voltage Rating: 50V; ComponentLink1URL: https://www.verical.com/server-webapp/html/getDatasheet?partID=409289&src-supplier=Verical; ComponentLink1Description: https://www.verical.com/server-webapp/html/getDatasheet?partID=409289&src-supplier=Verical; Supplier 1: Digi-Key; Manufacturer Part Number: RC0603FR-071KL; Stock 1: 21472395; Pricing 1: 1=0.1, 10=0.023, 100=0.0094, 1000=0.0042, 2500=0.0037 (USD); Case/Package: 0603; Contact Plating: Tin,Matte; Case Code (Imperial): 0603; Case Code (Metric): 1608; Min Operating Temperature: -55°C; Max Operating Temperature: 155°C; Tolerance: 1%; Composition: Thick Film; Packaging: Tape and Reel; Termination: SMD/SMT; Military Standard: Not; Length: 1.6mm; Height: 0.45mm; Depth: 0.8mm; Radiation Hardening: No; REACH SVHC: No SVHC; Lead Free: Lead Free; ComponentLink2URL: http://documents.rs-components.com/techlib://itc_doclist_GB.htm?stockno=5048928&src-supplier=RSComponents; ComponentLink2Description: http://documents.rs-components.com/techlib://itc_doclist_GB.htm?stockno=5048928&src-supplier=RSComponents; ComponentLink3URL: http://www.yageo.com/documents/recent/PYu-RC0603_51_RoHS_L_4.pdf?src-supplier=Avnet+Europe; ComponentLink3Description: http://www.yageo.com/documents/recent/PYu-RC0603_51_RoHS_L_4.pdf?src-supplier=Avnet+Europe; ComponentLink4URL: http://www.farnell.com/datasheets/2167052.pdf?src-supplier=Element14; ComponentLink4Description: http://www.farnell.com/datasheets/2167052.pdf?src-supplier=Element14; ComponentLink5URL: http://www.farnell.com/datasheets/1868787.pdf?src-supplier=Element14; ComponentLink5Description: http://www.farnell.com/datasheets/1868787.pdf?src-supplier=Element14; ComponentLink6URL: http://www.yageo.com/documents/recent/PYu-RC_Group_51_RoHS_L_2.pdf?src-supplier=Avnet; ComponentLink6Description: http://www.yageo.com/documents/recent/PYu-RC_Group_51_RoHS_L_2.pdf?src-supplier=Avnet; ComponentLink7URL: https://www.verical.com/server-webapp/html/getDatasheet?partID=404327&src-supplier=Verical; ComponentLink7Description: https://www.verical.com/server-webapp/html/getDatasheet?partID=404327&src-supplier=Verical; ComponentLink8URL: http://www.farnell.com/datasheets/443971.pdf?src-supplier=Element14; ComponentLink8Description: http://www.farnell.com/datasheets/443971.pdf?src-supplier=Element14; Supplier Part Number 1: 311-1.00KHRDKR-ND
R59 = CRGH0603J100K: RES SMD 100K OHM 5% 1/5W 0603; Manufacturer: TE Connectivity; Resistance: 100kR; Temperature Coefficient: 100ppm/°C; Power Rating: 200mW; Voltage Rating: 50V; Number of Resistors: 1; Supplier 1: Digi-Key; Manufacturer Part Number: CRGH0603J100K; Stock 1: 23277; Pricing 1: 1=0.1, 10=0.049, 100=0.02, 1000=0.00899, 2500=0.0078 (USD); Mount: Surface Mount; Case/Package: 0603; Case Code (Imperial): 0603; Case Code (Metric): 1608; Min Operating Temperature: -55°C; Max Operating Temperature: 125°C; Tolerance: 5%; Packaging: Tape and Reel; Resistor Type: Thick Film,Power resistor; Number of Terminations: 2; Series: CRGH; Termination: Solder; Voltage Rating (DC): 50V; Resistance Tolerance: 5%; Technology: THICK FILM; Length: 1.6mm; Width: 0.8mm; Height: 0.45mm; Depth: 0.8mm; RoHS Compliant: Yes; REACH SVHC: No SVHC; ELV: Compliant; ComponentLink1URL: http://www.farnell.com/datasheets/2007183.pdf?src-supplier=Element14; ComponentLink1Description: http://www.farnell.com/datasheets/2007183.pdf?src-supplier=Element14; Supplier Part Number 1: A126393DKR-ND
U9 = SY6280AAC: SOT-23-5 PMIC - Power Distribution Switches RoHS; Manufacturer: Silergy Corp; Value: Custom; Manufacturer Part No: SY6280AAC; Package: SOT-23-5